# Altium schematic sheet LINK_PAGE.SchDoc
size A; SheetNumber: 1; SheetTotal: 5
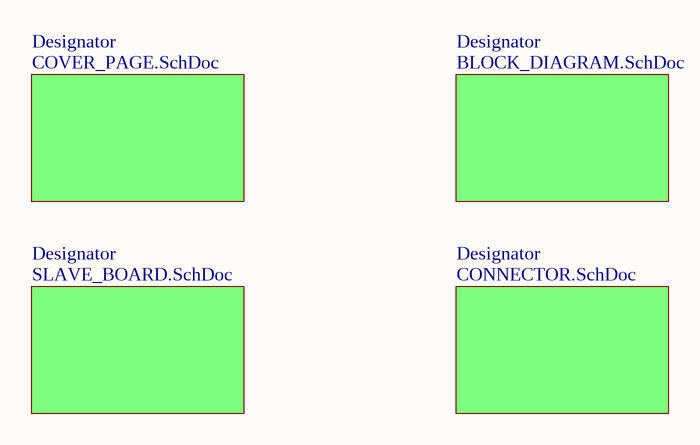
[diagram p0: LINK_PAGE.SchDoc]

## Sub-sheets
Designator = COVER_PAGE.SchDoc: no entries
Designator = BLOCK_DIAGRAM.SchDoc: no entries
Designator = SLAVE_BOARD.SchDoc: no entries
Designator = CONNECTOR.SchDoc: no entries